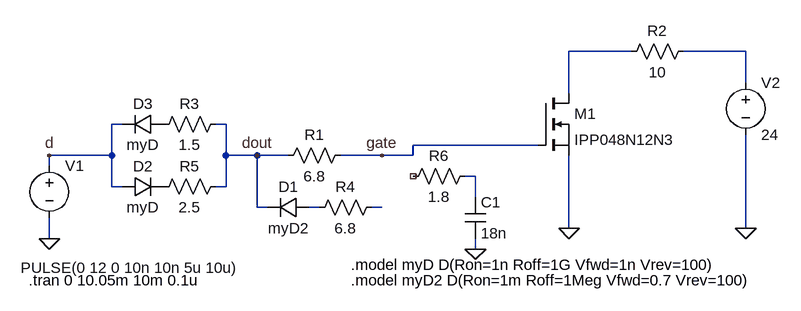
[diagram p0: schematic Treiber_sim.asc]
Treiber_sim.asc, the LTspice schematic file:
Version 4
SHEET 1 1176 680
WIRE 928 64 832 64
WIRE 1104 64 1008 64
WIRE 1104 112 1104 64
WIRE 832 128 832 64
WIRE 144 176 128 176
WIRE 304 176 288 176
WIRE 784 208 592 208
WIRE 128 224 128 176
WIRE 128 224 32 224
WIRE 304 224 304 176
WIRE 352 224 304 224
WIRE 400 224 352 224
WIRE 544 224 480 224
WIRE 592 224 592 208
WIRE 592 224 544 224
WIRE 32 240 32 224
WIRE 688 256 672 256
WIRE 128 272 128 224
WIRE 144 272 128 272
WIRE 304 272 304 224
WIRE 304 272 288 272
WIRE 688 288 688 256
WIRE 352 304 352 224
WIRE 368 304 352 304
WIRE 448 304 432 304
WIRE 544 304 528 304
WIRE 832 336 832 224
WIRE 1104 336 1104 192
WIRE 32 352 32 320
WIRE 688 368 688 352
FLAG 832 336 0
FLAG 32 352 0
FLAG 1104 336 0
FLAG 688 368 0
FLAG 544 224 gate
FLAG 32 224 d
FLAG 352 224 dout
SYMBOL nmos 784 128 R0
SYMATTR InstName M1
SYMATTR Value IPP048N12N3
SYMBOL voltage 32 224 R0
WINDOW 3 -44 173 Left 2
WINDOW 123 0 0 Left 0
WINDOW 39 -43 227 Left 2
SYMATTR Value PULSE(0 12 0 10n 10n 5u 10u)
SYMATTR InstName V1
SYMBOL res 496 208 R90
WINDOW 0 0 56 VBottom 2
WINDOW 3 32 56 VTop 2
SYMATTR InstName R1
SYMATTR Value 6.8
SYMBOL voltage 1104 96 R0
WINDOW 123 0 0 Left 0
WINDOW 39 0 0 Left 0
SYMATTR InstName V2
SYMATTR Value 24
SYMBOL res 1024 48 R90
WINDOW 0 0 56 VBottom 2
WINDOW 3 32 56 VTop 2
SYMATTR InstName R2
SYMATTR Value 10
SYMBOL res 544 288 R90
WINDOW 0 0 56 VBottom 2
WINDOW 3 32 56 VTop 2
SYMATTR InstName R4
SYMATTR Value 6.8
SYMBOL diode 144 288 R270
WINDOW 0 32 32 VTop 2
WINDOW 3 0 32 VBottom 2
SYMATTR InstName D2
SYMATTR Value myD
SYMBOL diode 208 160 R90
WINDOW 0 0 32 VBottom 2
WINDOW 3 32 32 VTop 2
SYMATTR InstName D3
SYMATTR Value myD
SYMBOL res 304 160 R90
WINDOW 0 0 56 VBottom 2
WINDOW 3 32 56 VTop 2
SYMATTR InstName R3
SYMATTR Value 1.5
SYMBOL res 304 256 R90
WINDOW 0 0 56 VBottom 2
WINDOW 3 32 56 VTop 2
SYMATTR InstName R5
SYMATTR Value 2.5
SYMBOL diode 432 288 R90
WINDOW 0 0 32 VBottom 2
WINDOW 3 32 32 VTop 2
SYMATTR InstName D1
SYMATTR Value myD2
SYMBOL cap 672 288 R0
SYMATTR InstName C1
SYMATTR Value 18n
SYMBOL res 688 240 R90
WINDOW 0 0 56 VBottom 2
WINDOW 3 32 56 VTop 2
SYMATTR InstName R6
SYMATTR Value 1.8
TEXT 0 416 Left 2 !.tran 0 10.05m 10m 0.1u
TEXT 496 392 Left 2 !.model myD D(Ron=1n Roff=1G Vfwd=1n Vrev=100)
TEXT 496 416 Left 2 !.model myD2 D(Ron=1m Roff=1Meg Vfwd=0.7 Vrev=100)

The netlist it stands for:
* Treiber_sim.asc
M1 N001 gate 0 0 IPP048N12N3
V1 d 0 PULSE(0 12 0 10n 10n 5u 10u)
R1 gate dout 6.8
V2 N002 0 24
R2 N002 N001 10
R4 N005 N004 6.8
D2 d P001 myD
D3 P002 d myD
R3 dout P002 1.5
R5 dout P001 2.5
D1 N004 dout myD2
C1 N003 0 18n
R6 N003 NC_01 1.8
.model D D
.lib standard.dio
.model NMOS NMOS
.model PMOS PMOS
.lib standard.mos
.tran 0 10.05m 10m 0.1u
.model myD D(Ron=1n Roff=1G Vfwd=1n Vrev=100)
.model myD2 D(Ron=1m Roff=1Meg Vfwd=0.7 Vrev=100)
.backanno
.end